# Altium schematic sheet Sheet2.SchDoc
size A4; SheetNumber: 2; SheetTotal: 2; SPICEModelCacheLDHAVKSM: <root> / <DocumentId>LDHAVKSM</DocumentId> / <CacheFrame Number="0"> / <Model Name="1n4005" Kind="MDL"> / <Text>*1N4005 MCE 8-16-95 / *600V 1A Si GenPurpose Diode pkg:DIODE0.4 1,2 / .MODEL 1N4005 D(IS=2.55E-9 RS=0.042 N=1.75 TT=5.76E-6 CJO=1.85E-11 / + VJ=0.75 M=0.333 BV=600 IBV=5.92E-5 )</Text> / </Model> / </CacheFrame> / </root>
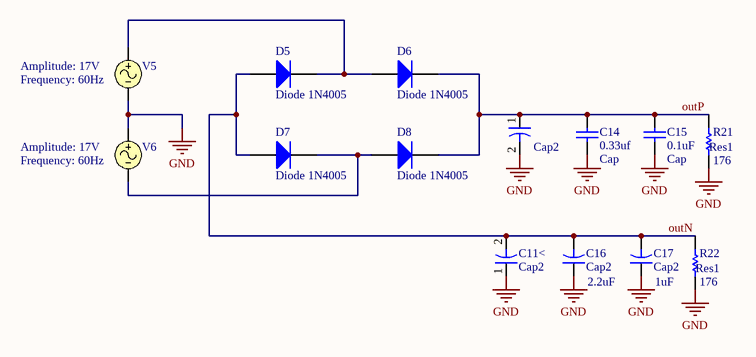
[diagram p0: Sheet2.SchDoc]

## Parts
C11<  Cap2  [CAPR5-4X5]
C14  Cap  value 0.33uf  [RAD-0.3]
C15  Cap  value 0.1uF  [RAD-0.3]
C16  Cap2  value 2.2uF  [CAPR5-4X5]
C17  Cap2  value 1uF  [CAPR5-4X5]
D5  Diode 1N4005  [DO-41]
D6  Diode 1N4005  [DO-41]
D7  Diode 1N4005  [DO-41]
D8  Diode 1N4005  [DO-41]
R21  Res1  value 176  [AXIAL-0.3]
R22  Res1  value 176  [AXIAL-0.3]
V5  Amplitude: 17V  Frequency: 60Hz  (hidden comment: SIN(0 17V 60Hz 0 0 0))
V6  Amplitude: 17V  Frequency: 60Hz  (hidden comment: SIN(0 17V 60Hz 0 0 0))
  Cap2  [CAPR5-4X5]

## Nets
GND: C11<.1 C14.1 C15.1 C16.1 C17.1 R21.2 R22.2 V5.2 V6.1 .2
outN: C11<.2 C16.2 C17.2 D5.1(A) D7.1(A) R22.1
outP: C14.2 C15.2 D6.2(K) D8.2(K) R21.1 .1
NetD5_2: D5.2(K) D6.1(A) V5.1
NetD7_2: D7.2(K) D8.1(A) V6.2

## Library data of the parts
C11<  = Cap2: Capacitor; Value: 680uF; Published: 23-Sep-2002; PackageReference: CAPR5-4X5; Publisher: Altium Limited; PackageDescription: Capacitor; 2 Leads
C14 C15 = Cap: Capacitor; Published: 8-Jun-2000; LatestRevisionDate: 17-Jul-2002; LatestRevisionNote: Re-released for DXP Platform.; PackageReference: RAD-0.3; Publisher: Altium Limited; PackageDescription: Radial Cap, Thru-Hole; 2 Leads; 0.3 in Pin Spacing
C16 C17 = Cap2: Capacitor; Published: 23-Sep-2002; PackageReference: CAPR5-4X5; Publisher: Altium Limited; PackageDescription: Capacitor; 2 Leads
D5-D8 = Diode 1N4005: 1 Amp General Purpose Rectifier; Published: 8-Jun-2000; LatestRevisionDate: 17-Jul-2002; LatestRevisionNote: Re-released for DXP Platform.; DatasheetVersion: 1998; PackageVersion: Aug-1999; PackageReference: DO-41; Publisher: Altium Limited; PackageDescription: Diode, Axial; Body 5.2 x 2.7 mm (LxDia. max), Lead Dia. 0.86 mm (max); Code_JEDEC: DO-204-AL; ComponentLink1Description: Manufacturer Link; ComponentLink1URL: http://www.fairchildsemi.com/; ComponentLink2Description: Datasheet; ComponentLink2URL: http://www.fairchildsemi.com/ds/1N%2F1N4001.pdf
R21 R22 = Res1: Resistor; Published: 8-Jun-2000; LatestRevisionDate: 17-Jul-2002; LatestRevisionNote: Re-released for DXP Platform.; PackageReference: AXIAL-0.3; Publisher: Altium Limited; PackageDescription: Axial Device, Thru-Hole; 2 Leads; 0.3 in Pin Spacing
V5 V6 = VSIN: Sinusoidal Voltage Source; Note: PCB Footprint - Not required; Offset: 0; AC Magnitude: 1; Published: 8-Jun-2000; LatestRevisionDate: 15-Nov-2004; LatestRevisionNote: Corrected Netlist.; PackageReference: Not Applicable; Publisher: Altium Limited; Delay: 0; Damping Factor: 0; Phase: 0; DC Magnitude: 0; AC Phase: 0